# Altium schematic sheet USB_C_MCU.SchDoc
size A4; DocumentNumber: 8; SheetNumber: 8; SheetTotal: 12
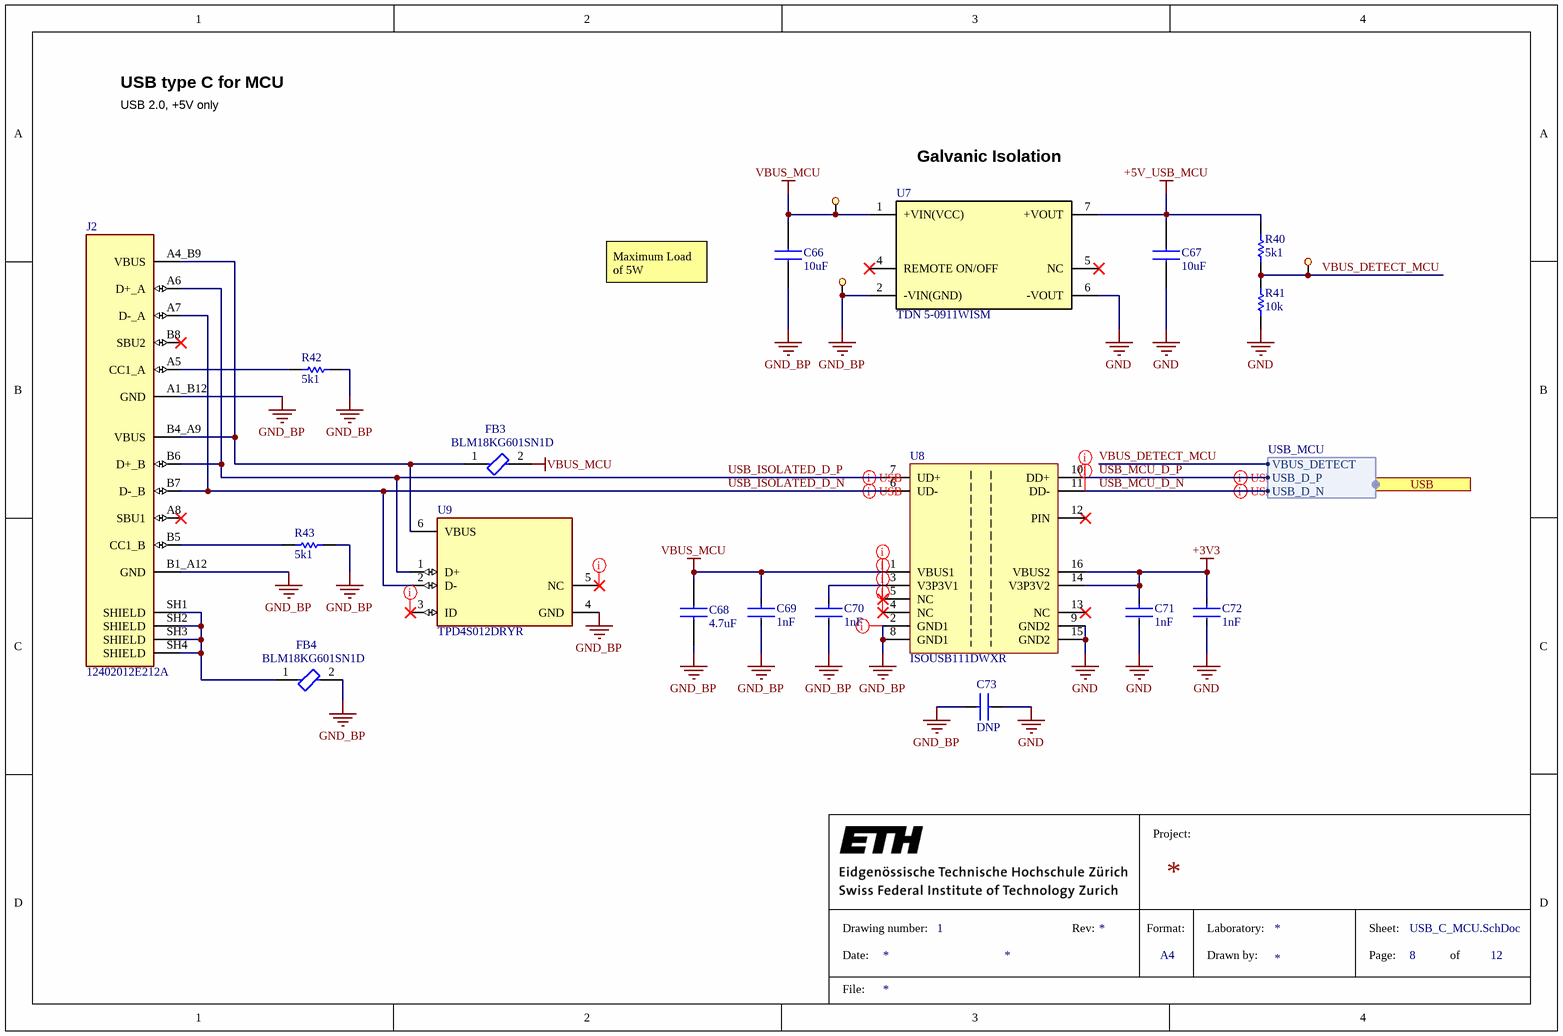
[diagram p0: USB_C_MCU.SchDoc]

## Parts
*19  testpoint  [testpoint]  (value not drawn)
*20  testpoint  [testpoint]  (value not drawn)
*21  testpoint  [testpoint]  (value not drawn)
C66  10uF  [CAPC2013X140N]
C67  10uF  [CAPC2013X140N]
C68  4.7uF  [CAPC1608X95N]
C69  1nF  [FP-C0805C-DN-MFG]
C70  1nF  [FP-C0805C-DN-MFG]
C71  1nF  [FP-C0805C-DN-MFG]
C72  1nF  [FP-C0805C-DN-MFG]
C73  DNP  [CAPC3216X180N]
FB3  BLM18KG601SN1D  [FP-BLM18-0_15-t0_8-IPC_A]
FB4  BLM18KG601SN1D  [FP-BLM18-0_15-t0_8-IPC_A]
J2  12402012E212A  [AMPHENOL_12402012E212A]
R40  5k1  [ERJUP6]
R41  10k  [RESC1005X40X25ML05T05]
R42  5k1  [ERJUP6]
R43  5k1  [ERJUP6]
U7  TDN 5-0911WISM  [TDN 5WISM SINGLE_TRP]
U8  ISOUSB111DWXR  [DWX0016A]
U9  TPD4S012DRYR  [FP-DRY0006A-MFG]

## Ports
USB (harness USB_MCU, see MAIN[6C], MCU[1A])

## Harnesses
USB_MCU: USB_D_P, USB_D_N, VBUS_DETECT

## Nets
+3V3: C71.1 C72.1 U8.14(V3P3V2) U8.16(VBUS2)
+5V_USB_MCU: C67.2 R40.1 U7.7(+VOUT)
GND: C67.1 C71.2 C72.2 C73.1 R41.1 U7.6(-VOUT) U8.9(GND2) U8.15(GND2)
GND_BP: *21.1 C66.1 C68.1 C69.2 C70.2 C73.2 FB4.2 J2.A1_B12(GND) J2.B1_A12(GND) R42.1 R43.1 U7.2(-VIN(GND)) U8.2(GND1) U8.8(GND1) U9.4(GND)
VBUS_MCU: *19.1 C66.2 C68.2 C69.1 FB3.2 U7.1(+VIN(VCC)) U8.1(VBUS1)
USB_ISOLATED_D_N: J2.A7(D-_A) J2.B7(D-_B) U8.6(UD-) U9.2(D-)
USB_ISOLATED_D_P: J2.A6(D+_A) J2.B6(D+_B) U8.7(UD+) U9.1(D+)
USB_MCU_D_N: U8.11(DD-) ; port USB.USB_D_N
USB_MCU_D_P: U8.10(DD+) ; port USB.USB_D_P
VBUS_DETECT_MCU: *20.1 R40.2 R41.2 ; port USB.VBUS_DETECT
NetC70_1: C70.1 U8.3(V3P3V1)
NetFB3_1: FB3.1 J2.A4_B9(VBUS) J2.B4_A9(VBUS) U9.6(VBUS)
NetFB4_1: FB4.1 J2.SH1(SHIELD) J2.SH2(SHIELD) J2.SH3(SHIELD) J2.SH4(SHIELD)
NetJ2_A5: J2.A5(CC1_A) R42.2
NetJ2_B5: J2.B5(CC1_B) R43.2

Not connected (* = marked no-connect by the designer): J2 A8(SBU1)* B8(SBU2)*; U7 4(REMOTE_ON/OFF)* 5(NC)*; U8 4(NC)* 5(NC)* 12(PIN)* 13(NC)*; U9 3(ID)* 5(NC)*

## Layout directives
net class USB_isolated: NetC70_1, NetU8_4, NetU8_5, NetU9_3, NetU9_5, VBUS_MCU
mark named USB: GND_BP
net class D90: USB_MCU_D_N, USB_MCU_D_P
differential pair; differential pair class USB_90R_isolated; rule Matched Net Lengths [Tolerance = 100mil]; net class USB_90R_isolated: USB_ISOLATED_D_N, USB_ISOLATED_D_P
differential pair; differential pair class USB_90R; rule Matched Net Lengths [Tolerance = 100mil]; net class USB_90R: USB_MCU_D_N, USB_MCU_D_P

## Notes on the sheet
- USB type C for MCU
- USB 2.0, +5V only
- (near U7) Galvanic Isolation
- Maximum Load of 5W
- Project:
- Drawing number:
- Date:
- 1
- Rev:
- Format:
- A4
- Laboratory:
- Drawn by:
- Sheet:
- Page:
- of
- File:

## Library data of the parts
C66 C67 = LMK212AB7106MG-T: Capacitor 10uF 0805; Manufacturer_Name: TAIYO YUDEN; Datasheet Link: https://datasheet.datasheetarchive.com/originals/distributors/Datasheets-DGA20/25674.pdf; Height: 1.4mm; Mouser Part Number: 963-LMK212AB7106MG-T; Mouser Price/Stock: https://www.mouser.co.uk/ProductDetail/Taiyo-Yuden/LMK212AB7106MG-T?qs=CNQs48zzdnrud19jlu61Cg%3D%3D; Manufacturer Part Number: LMK212AB7106MG-T; Supplier 1: Digikey; Supplier Part Number 1: 587-3417-1-ND
C68 = CL10B475KQ8NQNC: Capacitor 4.7uF 0603; Manufacturer_Name: SAMSUNG; Datasheet Link: https://datasheet.datasheetarchive.com/originals/distributors/Datasheets-DGA10/2410603.pdf; Height: 0.95mm; Manufacturer Part Number: CL10B475KQ8NQNC; Mouser Part Number: 187-CL10B475KQ8NQNC; Mouser Price/Stock: https://www.mouser.co.uk/ProductDetail/Samsung-Electro-Mechanics/CL10B475KQ8NQNC?qs=6tbHoouHnQxd6rcaSwpT7Q%3D%3D; Arrow Part Number: CL10B475KQ8NQNC; Arrow Price/Stock: https://www.arrow.com/en/products/cl10b475kq8nqnc/samsung-electro-mechanics; Supplier 1: Digikey; Supplier Part Number 1: 1276-2087-1-ND
C69-C72 = CMP-2007-00235-2: Capacitor 1nF 0805; Manufacturer: KEMET; Manufacturer Part Number: C0805C102J5GACTU; Value: 1,000 pF; Voltage Rating: 50 V; Temperature Characteristic: C0G; Material: Ceramic; Temperature Coefficient: 30ppm/°C; Tolerance: 0.05; Automotive: No; Device Class L1: Passive Components; Digikey Description: CAP CER 1000PF 50V C0G/NP0 0805; Lead Free: Yes; Capacitance: 1,000 pF; Package: C0805C-DN; RoHS: TRUE; Temperature Range High: +125°C; Height: 0.88mm; Ipc Land Pattern Name: CAPC200125X78; Category: Cap; ComponentLink2URL: https://content.kemet.com/datasheets/KEM_C1003_C0G_SMD.pdf; Device Class L2: Capacitors; ComponentLink2Description: Datasheet; Temperature: -55°C to +125°C; Octopart: https://octopart.com/c0805c102j5gactu-kemet-97757; Mouser Description: Multilayer Ceramic Capacitors MLCC - SMD/SMT 50volts 1000pF C0G 5%; Device Class L3: Ceramic Capacitors; Temperature Range Low: -55°C; Supplier 1: Mouser; Supplier Part Number 1: 80-C0805C102J5G
C73 = CL31B102KJHNNNE: Capacitor 1nF/2kV 3216 Isolated GND Loop Cap; Manufacturer_Name: SAMSUNG; Datasheet Link: https://www.tme.com/Document/4a42202b32dab16128fe107dd69598cc/samsung-chip-cap.pdf; Height: 1.8mm; Manufacturer Part Number: CL31B102KJHNNNE; Mouser Part Number: 187-CL31B102KJHNNNE; Mouser Price/Stock: https://www.mouser.co.uk/ProductDetail/Samsung-Electro-Mechanics/CL31B102KJHNNNE?qs=X6jEic%2FHinAYVHtIjHgytw%3D%3D; Arrow Part Number: CL31B102KJHNNNE; Arrow Price/Stock: https://www.arrow.com/en/products/cl31b102kjhnnne/samsung-electro-mechanics?utm_currency=USD&region=nac; Supplier 1: DigiKey; Supplier Part Number 1: 1276-3073-1-ND
FB3 FB4 = CMP-0686-00581-3: Chip Ferrite Bead, 0603, 600Ω @ 100MHz, 0.15Ω, 25%, 1.3A; Material: Steel; Number of Lines: 1; Impedance: 600R; DC Resistance (DCR): 150mR; Tolerance: 25%; Case Code (Metric): 1608; Width: 0.8mm; DC Current: 1.3A; Max DC Current: 1.3A; Package Quantity: 1; Number of Pins: 2; Military Standard: Not; RoHS Compliant: Yes; Termination: SMD/SMT; Max Operating Temperature: 125°C; Length: 1.6mm; Depth: 0.8mm; Case Code (Imperial): 0603; Series: BLM18K; Inductor Type: FERRITE BEAD; Core Material: Ferrite; Number of Circuits: 1; Height: 0.8mm; Case/Package: 0603; REACH SVHC: No SVHC; Packaging: Tape and Reel; Min Operating Temperature: -55°C; Max Current Rating: 1.3A; Radiation Hardening: No; Current Rating: 1.3A; Lead Free: Lead Free; Test Frequency: 100MHz; Weight: 7.1E-05oz
J2 = 12402012E212A: USB2.0, Type C, Top mount, CH 1.68mm, Dual Row SMT; MF: Amphenol ICC (Commercial Products); MP: 12402012E212A; Price: None; Package: None; Availability: In Stock; SnapEDA_Link: https://www.snapeda.com/parts/12402012E212A/Amphenol/view-part/?ref=snap; Value: *; Check_prices: https://www.snapeda.com/parts/12402012E212A/Amphenol/view-part/?ref=eda; Purchase-URL: https://pricing.snapeda.com/search/part/12402012E212A/?ref=eda; Manufacturer Part Number: 12402012E212A; Supplier 1: Digikey; Supplier Part Number 1: 664-12402012E212ACT-ND
R40 R42 R43 = ERJ-UP6D5101V: Resistor 5k1 0805; Manufacturer_Name: Panasonic; Datasheet Link: https://industrial.panasonic.com/cdbs/www-data/pdf/RDP0000/AOA0000C337.pdf; Height: 0.7mm; Mouser Part Number: 667-ERJ-UP6D5101V; Mouser Price/Stock: https://www.mouser.co.uk/ProductDetail/Panasonic/ERJ-UP6D5101V?qs=ZcfC38r4Pouz7%2FLHthUDHQ%3D%3D; Arrow Part Number: ERJ-UP6D5101V; Arrow Price/Stock: https://www.arrow.com/en/products/erj-up6d5101v/panasonic?utm_currency=USD&region=nac; Supplier 1: Mouser; Supplier Part Number 1: 667-ERJ-UP6D5101V; Manufacturer Part Number: ERJ-UP6D5101V
R41 = CMP-2002-00433-1: Resistor 10k 0402; Manufacturer Part Number: ERJ-2GEJ103X; Manufacturer: Panasonic; Supplier 1: Mouser; Supplier Part Number 1: 667-ERJ-2GEJ103X
U7 = TDN 5-0911WISM: TDN 5-0911WISM DC-DC Converter, 5V, 1A; No. of Outputs: 1 Output; Output Power Max: 5W; Voltage - 1: 5V; Current 1: 1A;; NexarPartId: 76519263; Number of Outputs: 1; RoHS: Compliant; Output Power: 5W; Width: 9.1mm; Height: 10.2mm; Supplier: DigiKey; Supplier Part Number: TDN5-0911WISM-ND
U8 = ISOUSB111DWXR: Low emissions, full and low speed isolated USB repeater 16-SSOP -40 to 125; Manufacturer: Texas Instruments; Supplier: Digikey; Supplier Part Number: 296-ISOUSB111DWXRCT-ND; Manufacturer Part Number: ISOUSB111DWXR; RoHS: No; Stock: 317; Pricing: 1=10.29, 10=9.294, 25=8.8616, 100=7.6946, 250=7.34876, 500=6.70034 (USD); Supplier 1: Digikey; Supplier Part Number 1: 296-ISOUSB111DWXRCT-ND
U9 = CMP-0326-00038-4: TVS DIODE 5.5V 6SON; Breakdown Voltage: 24V; Interface: USB; ESD Protection: Yes; Peak Pulse Power: 60W; Number of Circuits: 4; Polarity: Unidirectional; Capacitance: 15pF; Test Current: 1mA; Working Voltage: 19V; Min Breakdown Voltage: 6V; Peak Pulse Current: 3A; Operating Supply Voltage: 950mV; Max Operating Temperature: 85°C; Packaging: Tape and Reel; Termination: SMD/SMT; Number of Pins: 6; Radiation Hardening: No; Width: 1.05mm; REACH SVHC: No SVHC; Lead Free: Lead Free; Depth: 1mm; Package Quantity: 5000; Length: 1.45mm; Direction: Unidirectional; Min Operating Temperature: -40°C; Number of Channels: 4; Max Power Dissipation: 60W; Height: 0.55mm; Manufacturer Part Number: TPD4S012DRYR